# Altium schematic sheet LCD_RGB_parallel_connector.SchDoc
size A3; SheetNumber: 17; SheetTotal: 18
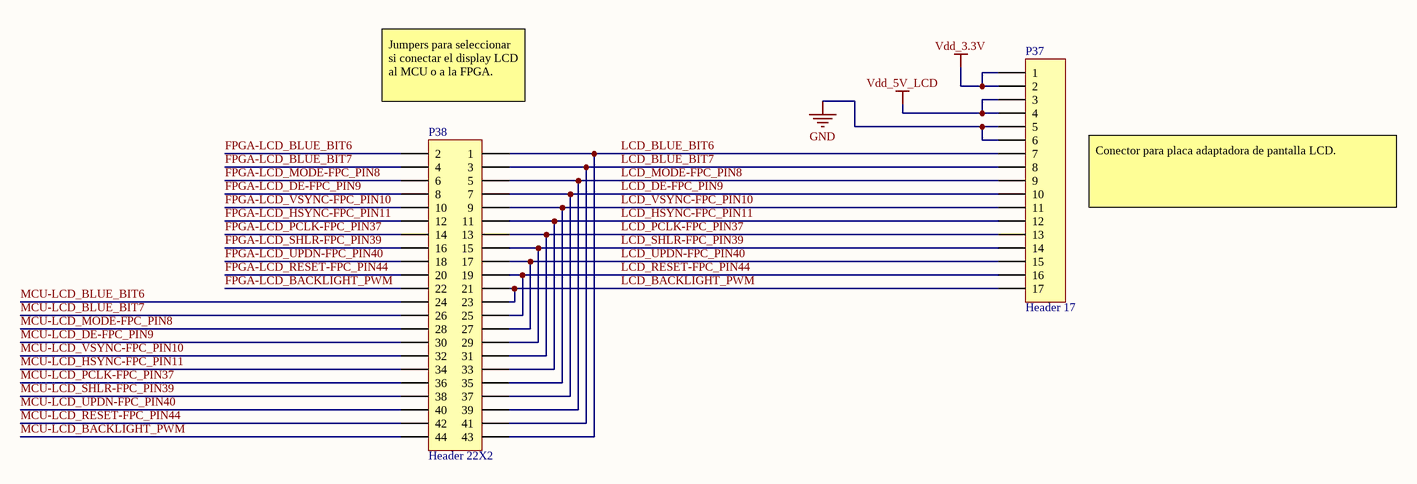
[diagram p0: LCD_RGB_parallel_connector.SchDoc]

## Parts
P37  Header 17  [HDR1X17]
P38  Header 22X2  [HDR2X22]

## Nets
GND: P37.5 P37.6
Vdd_3.3V: P37.1 P37.2
Vdd_5V_LCD: P37.3 P37.4
FPGA-LCD_BACKLIGHT_PWM: P38.22
FPGA-LCD_BLUE_BIT6: P38.2
FPGA-LCD_BLUE_BIT7: P38.4
FPGA-LCD_DE-FPC_PIN9: P38.8
FPGA-LCD_HSYNC-FPC_PIN11: P38.12
FPGA-LCD_MODE-FPC_PIN8: P38.6
FPGA-LCD_PCLK-FPC_PIN37: P38.14
FPGA-LCD_RESET-FPC_PIN44: P38.20
FPGA-LCD_SHLR-FPC_PIN39: P38.16
FPGA-LCD_UPDN-FPC_PIN40: P38.18
FPGA-LCD_VSYNC-FPC_PIN10: P38.10
LCD_BACKLIGHT_PWM: P37.17 P38.21 P38.23
LCD_BLUE_BIT6: P37.7 P38.1 P38.43
LCD_BLUE_BIT7: P37.8 P38.3 P38.41
LCD_DE-FPC_PIN9: P37.10 P38.7 P38.37
LCD_HSYNC-FPC_PIN11: P37.12 P38.11 P38.33
LCD_MODE-FPC_PIN8: P37.9 P38.5 P38.39
LCD_PCLK-FPC_PIN37: P37.13 P38.13 P38.31
LCD_RESET-FPC_PIN44: P37.16 P38.19 P38.25
LCD_SHLR-FPC_PIN39: P37.14 P38.15 P38.29
LCD_UPDN-FPC_PIN40: P37.15 P38.17 P38.27
LCD_VSYNC-FPC_PIN10: P37.11 P38.9 P38.35
MCU-LCD_BACKLIGHT_PWM: P38.44
MCU-LCD_BLUE_BIT6: P38.24
MCU-LCD_BLUE_BIT7: P38.26
MCU-LCD_DE-FPC_PIN9: P38.30
MCU-LCD_HSYNC-FPC_PIN11: P38.34
MCU-LCD_MODE-FPC_PIN8: P38.28
MCU-LCD_PCLK-FPC_PIN37: P38.36
MCU-LCD_RESET-FPC_PIN44: P38.42
MCU-LCD_SHLR-FPC_PIN39: P38.38
MCU-LCD_UPDN-FPC_PIN40: P38.40
MCU-LCD_VSYNC-FPC_PIN10: P38.32

## Notes on the sheet
- (near P38) Jumpers para seleccionar si conectar el display LCD al MCU o a la FPGA.
- Conector para placa adaptadora de pantalla LCD.

## Library data of the parts
P37 = Header 17: Header, 17-Pin; LatestRevisionDate: 17-Jul-2002; LatestRevisionNote: Re-released for DXP Platform.; Publisher: Altium Limited
P38 = Header 22X2: Header, 22-Pin, Dual row; LatestRevisionDate: 17-Jul-2002; LatestRevisionNote: Re-released for DXP Platform.; Publisher: Altium Limited